# Altium schematic sheet power.SchDoc
size 508 x 381 mm
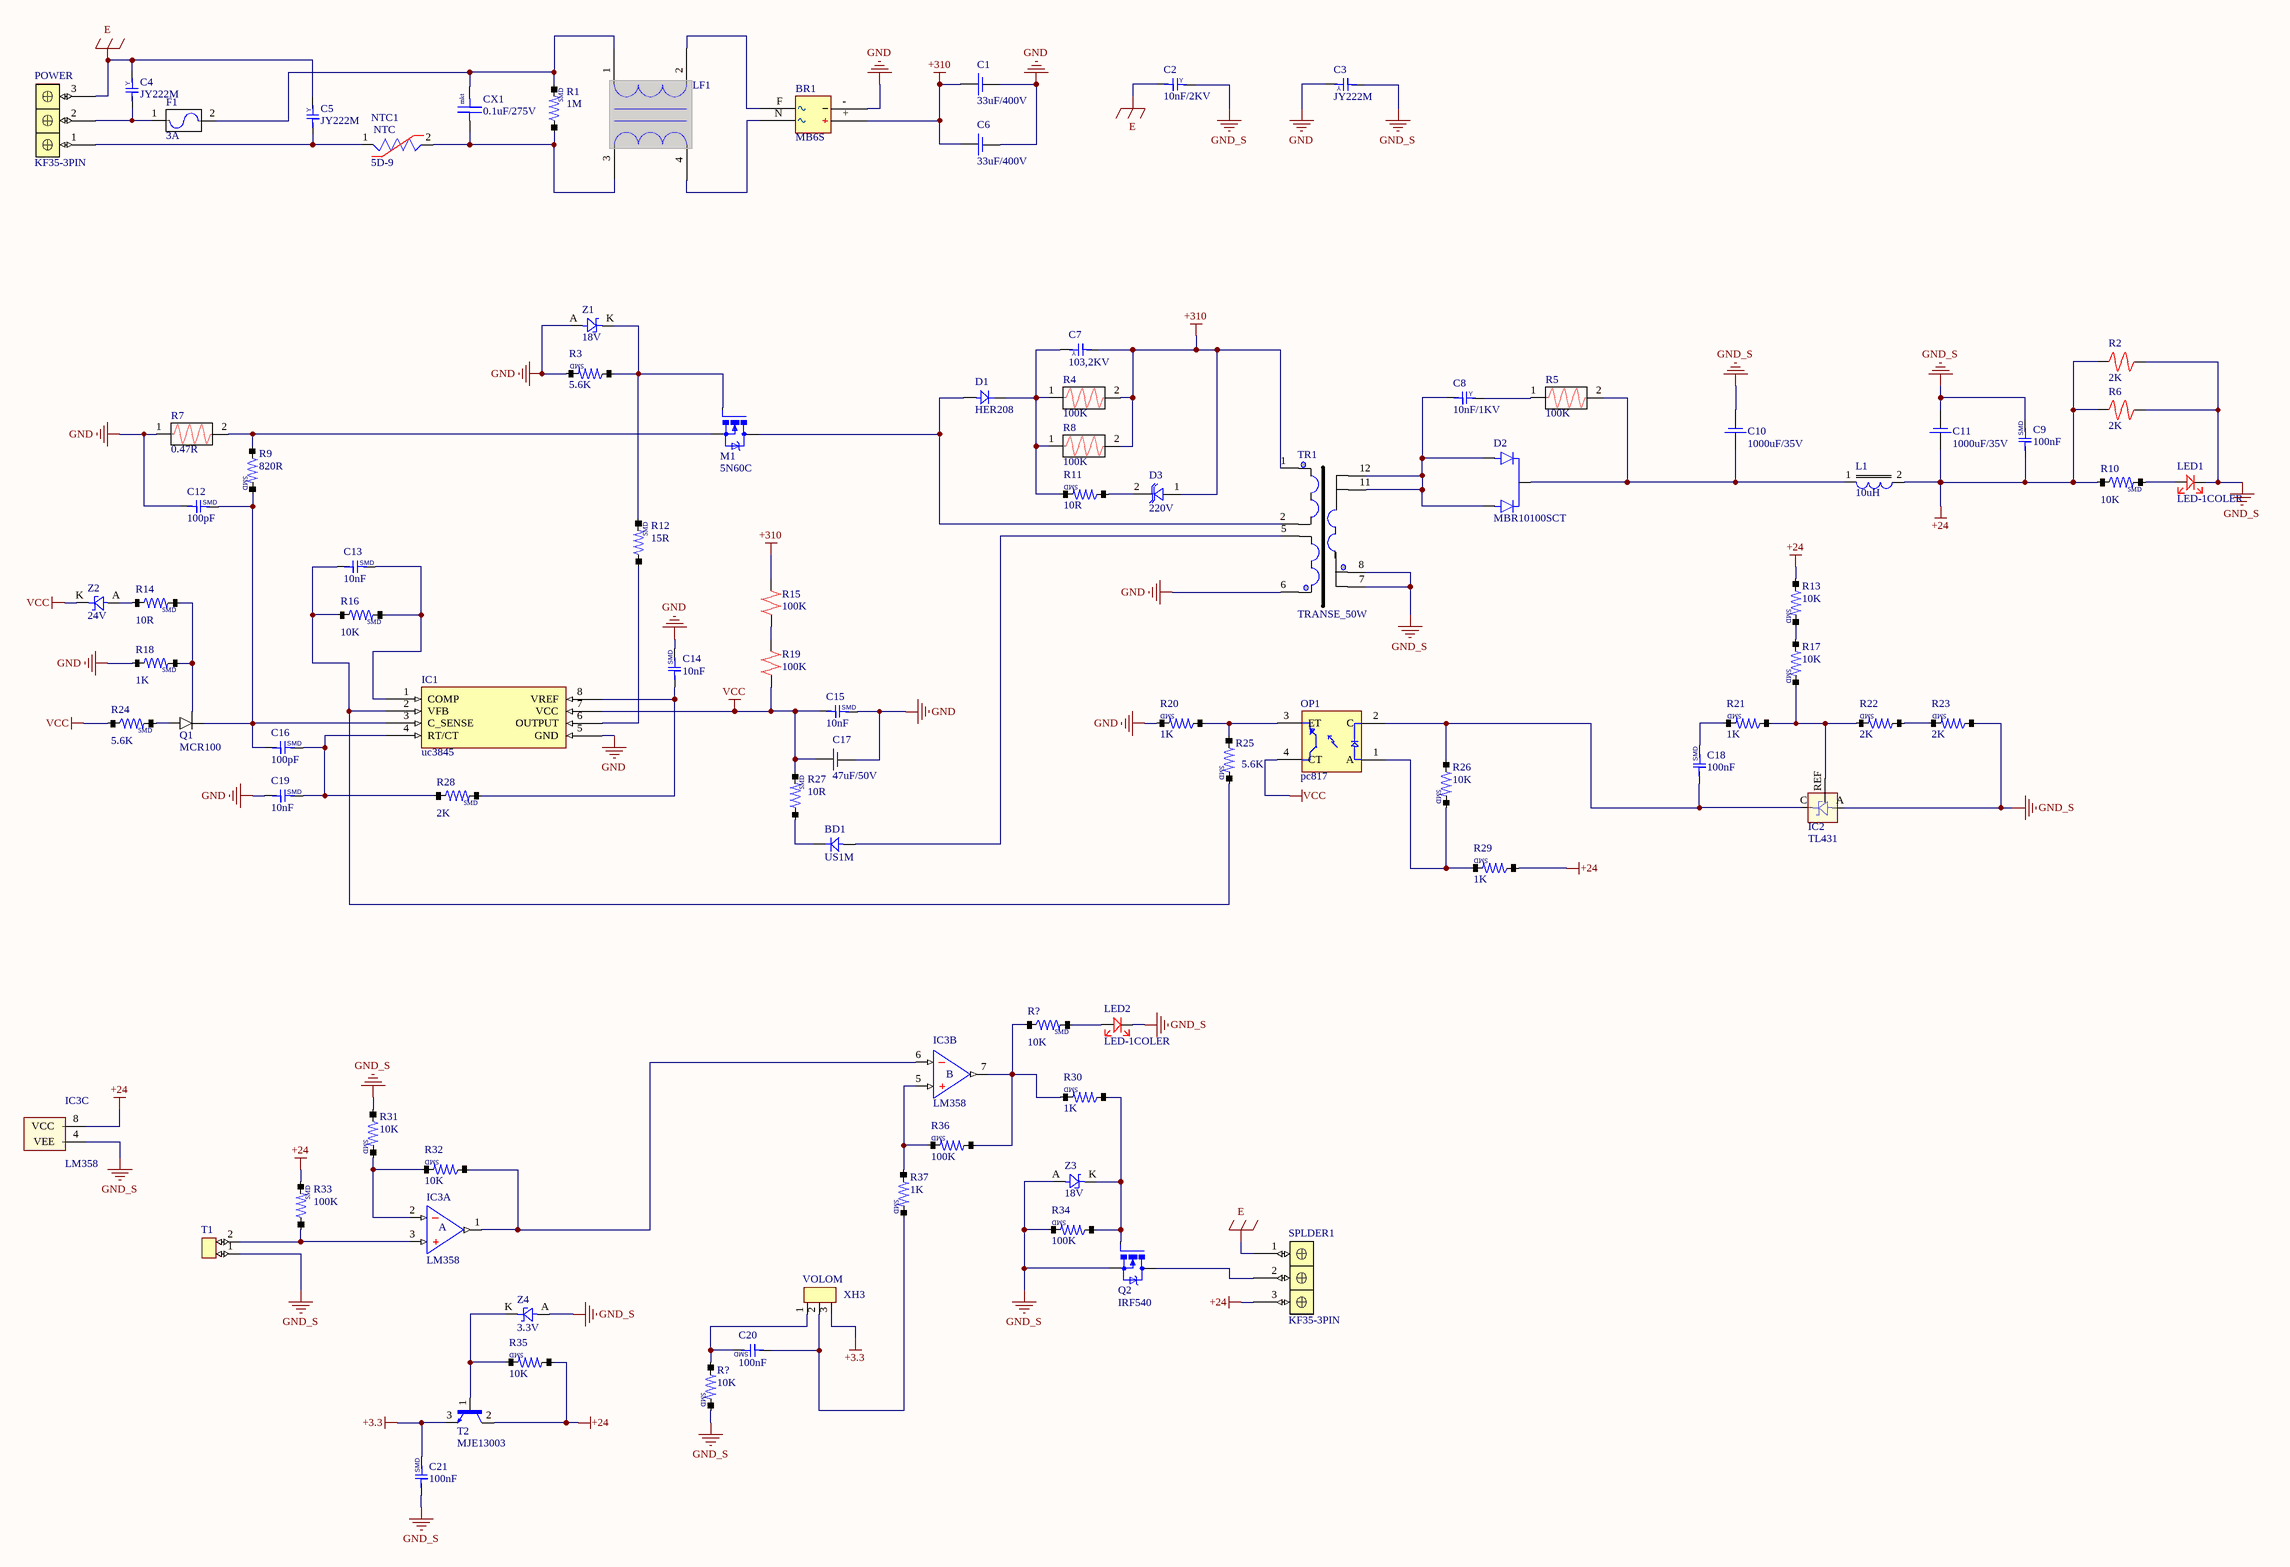
[diagram p0: power.SchDoc]

## Parts
(Parts that share a designator on the sheet are numbered #1, #2 ... from top to bottom, then left to right.)
BD1  US1M  [DIOD/1N4007/SMD]
BR1  MB6S  [MB6S/SMD]
C1  33uF/400V  [CAP-EL-P7MM]
C2  10nF/2KV  [CAP_Y_2KV]
C3  JY222M  [CAP_Y_4KV]
C4  JY222M  [CAP_Y_4KV]
C5  JY222M  [CAP_Y_4KV]
C6  33uF/400V  [CAP-EL-P7MM]
C7  103,2KV  [CAP_Y_1KV]
C8  10nF/1KV  [CAP_Y_2KV]
C9  100nF  [CAP-0603]
C10  1000uF/35V  [CAP-EL_P5MM]
C11  1000uF/35V  [CAP-EL_P5MM]
C12  100pF  [CAP-0603]
C13  10nF  [CAP-0603]
C14  10nF  [CAP-0603]
C15  10nF  [CAP-0603]
C16  100pF  [CAP-0603]
C17  47uF/50V  [cap/330u/16v]
C18  100nF  [CAP-0603]
C19  10nF  [CAP-0603]
C20  100nF  [CAP-0603]
C21  100nF  [CAP-0603]
CX1  0.1uF/275V  [CAP/0.22uF/275v/mkt]
D1  HER208  [DIOD/1N4007/SMD]
D2  MBR10100SCT  [TO220AB]
D3  220V  [TVS-5V-SMD]
F1  3A  [fuze_glass]
IC1  uc3845  [SOP-8]
IC2  TL431  [TL431]
IC3  LM358  [SOP-8]  (parts A,B,C of 3)
L1  10uH  [INDUCTOR-10*16]
LED1  LED-1COLER  [led/3MM/DIP]
LED2  LED-1COLER  [led/3MM/DIP]
LF1  (no value)  [EMI_MID]
M1  5N60C  [TO-220]
NTC1  5D-9  [NTC_XD_7]
OP1  pc817  [pc817]
POWER  KF35-3PIN  [XH3_BIG]
Q1  MCR100  [TO-225]
Q2  IRF540  [TO-220]
R1  1M  [RES/1206]
R2  2K  [RES/0.25W]
R3  5.6K  [RES/0805]
R4  100K  [RES/1W]
R5  100K  [RES/1W]
R6  2K  [RES/0.25W]
R7  0.47R  [RES/1W]
R8  100K  [RES/1W]
R9  820R  [RES/0805]
R10  10K  [RES/1206]
R11  10R  [RES/1206]
R12  15R  [RES/1206]
R13  10K  [RES/0603]
R14  10R  [RES/0603]
R15  100K  [RES/0.25W]
R16  10K  [RES/0603]
R17  10K  [RES/0603]
R18  1K  [RES/0603]
R19  100K  [RES/0.25W]
R20  1K  [RES/0603]
R21  1K  [RES/0603]
R22  2K  [RES/0603]
R23  2K  [RES/0603]
R24  5.6K  [RES/0603]
R25  5.6K  [RES/0603]
R26  10K  [RES/0603]
R27  10R  [RES/1206]
R28  2K  [RES/0603]
R29  1K  [RES/0603]
R30  1K  [RES/0603]
R31  10K  [RES/0603]
R32  10K  [RES/0603]
R33  100K  [RES/0603]
R34  100K  [RES/0603]
R35  10K  [RES/0805]
R36  100K  [RES/0603]
R37  1K  [RES/0603]
R?#1  10K  [RES/1206]
R?#2  10K  [RES/0805]
SPLDER1  KF35-3PIN  [XH3_BIG]
T1  (no value)  [CONECTOR/XH/2PIN]
T2  MJE13003  [TO-225]
TR1  TRANSE_50W  [TRANSE_50W]
VOLOM  XH3  [XH3]
Z1  18V  [DIOD/RS1J]
Z2  24V  [DIOD/RS1J]
Z3  18V  [DIOD/RS1J]
Z4  3.3V  [DIOD/RS1J]

## Nets
+3.3: C21.2 T2.3(E) VOLOM.3
+24: C9.1 C11.+ IC3.8(VCC) L1.2 R2.1 R6.1 R10.1 R13.1 R29.1 R33.2 R35.1 SPLDER1.3 T2.2(C)
+310: BR1.+ C1.+ C6.+ C7.1 D3.1 R4.2 R8.2 R15.2 TR1.1
E: C2.1 C4.2 C5.2 POWER.3 SPLDER1.1
GND: BR1.- C1.- C3.2 C6.- C12.1 C14.2 C15.2 C17.- C19.1 IC1.5(GND) R3.2 R7.1 R18.1 R20.2 TR1.6 Z1.A
GND_S: C2.2 C3.1 C9.2 C10.- C11.- C21.1 IC2.A IC3.4(VEE) LED1.K LED2.K Q2.3(s) R2.2 R6.2 R23.1 R31.1 R34.2 R?#2.2 T1.1 TR1.7 TR1.8 Z3.A Z4.A
VCC: C15.1 C17.+ IC1.7(VCC) OP1.4(CT) R19.1 R24.1 R27.2 Z2.K
NetBD1_A: BD1.A TR1.5
NetBD1_K: BD1.K R27.1
NetBR1_F: BR1.F LF1.2
NetBR1_N: BR1.N LF1.4
NetC4_1: C4.1 F1.1 POWER.2
NetC5_1: C5.1 NTC1.1 POWER.1
NetC7_2: C7.2 D1.K R4.1 R8.1 R11.2
NetC8_1: C8.1 D2.1(A1) D2.3(A2) TR1.11 TR1.12
NetC8_2: C8.2 R5.1
NetC10_+: C10.+ D2.2(C) L1.1 R5.2
NetC12_2: C12.2 C16.1 IC1.3(C_SENSE) Q1.3(C) R9.2
NetC13_1: C13.1 IC1.2(VFB) R16.1 R25.2
NetC13_2: C13.2 IC1.1(COMP) R16.2
NetC14_1: C14.1 IC1.8(VREF) R28.2
NetC16_2: C16.2 C19.2 IC1.4(RT/CT) R28.1
NetC18_1: C18.1 IC2.C OP1.2(C) R26.1
NetC18_2: C18.2 R21.2
NetC20_1: C20.1 R37.2 VOLOM.2
NetC20_2: C20.2 R?#2.1 VOLOM.1
NetCX1_1: CX1.1 LF1.3 NTC1.2 R1.1
NetCX1_2: CX1.2 F1.2 LF1.1 R1.2
NetD1_A: D1.A M1.2(D) TR1.2
NetD3_2: D3.2 R11.1
NetIC1_6: IC1.6(OUTPUT) R12.1
NetIC2_REF: IC2.REF R17.2 R21.1 R22.2
NetIC3_1: IC3.1 IC3.6 R32.1
NetIC3_2: IC3.2 R31.2 R32.2
NetIC3_3: IC3.3 R33.1 T1.2
NetIC3_5: IC3.5 R36.2 R37.1
NetIC3_7: IC3.7 R30.2 R36.1 R?#1.1
NetLED1_A: LED1.A R10.2
NetLED2_A: LED2.A R?#1.2
NetM1_1: M1.1(G) R3.1 R12.2 Z1.K
NetM1_3: M1.3(s) R7.2 R9.1
NetOP1_1: OP1.1(A) R26.2 R29.2
NetOP1_3: OP1.3(ET) R20.1 R25.1
NetQ1_1: Q1.1(A) R24.2
NetQ1_2: Q1.2(G) R14.2 R18.2
NetQ2_1: Q2.1(G) R30.1 R34.1 Z3.K
NetQ2_2: Q2.2(D) SPLDER1.2
NetR13_2: R13.2 R17.1
NetR14_1: R14.1 Z2.A
NetR15_1: R15.1 R19.2
NetR22_1: R22.1 R23.2
NetR35_2: R35.2 T2.1(B) Z4.K

## Notes on the sheet
- (in symbol cap-mkt) mkt
- (in symbol cap_smd) SMD
- (in symbol CAP_Y) Y
- (in symbol LM358, part A) A
- (in symbol LM358, part B) B
- (in symbol RES/SMD) SMD

## Library data of the parts
BD1 D1 = DIOD/RECTIFIERS
BR1 = BRIDGE RECTIFIERS
C1 C6 C10 C11 C17 = cap-electrolit
C2-C5 C7 C8 = CAP_Y
C9 C12-C16 C18-C21 = cap_smd
CX1 = cap-mkt
D2 = DIOD_double
D3 = TVS-SMD
F1 = fuze
L1 = inductor
LF1 = emi_chok_yd
M1 Q2 = MOSFET_N_CH
NTC1 = NTC
R1 R3 R9-R14 R16-R18 R20-R37 R?#1 R?#2 = RES/SMD
R2 R6 R15 R19 = RES/<1W
R4 R5 R7 R8 = RES/>=1W
T1 = CONECTOR/XH/2PIN
T2 = NPN
Z1-Z4 = zener-0.5w